# Altium schematic sheet Breakout.SchDoc
size A4; SheetNumber: 1; SheetTotal: 1
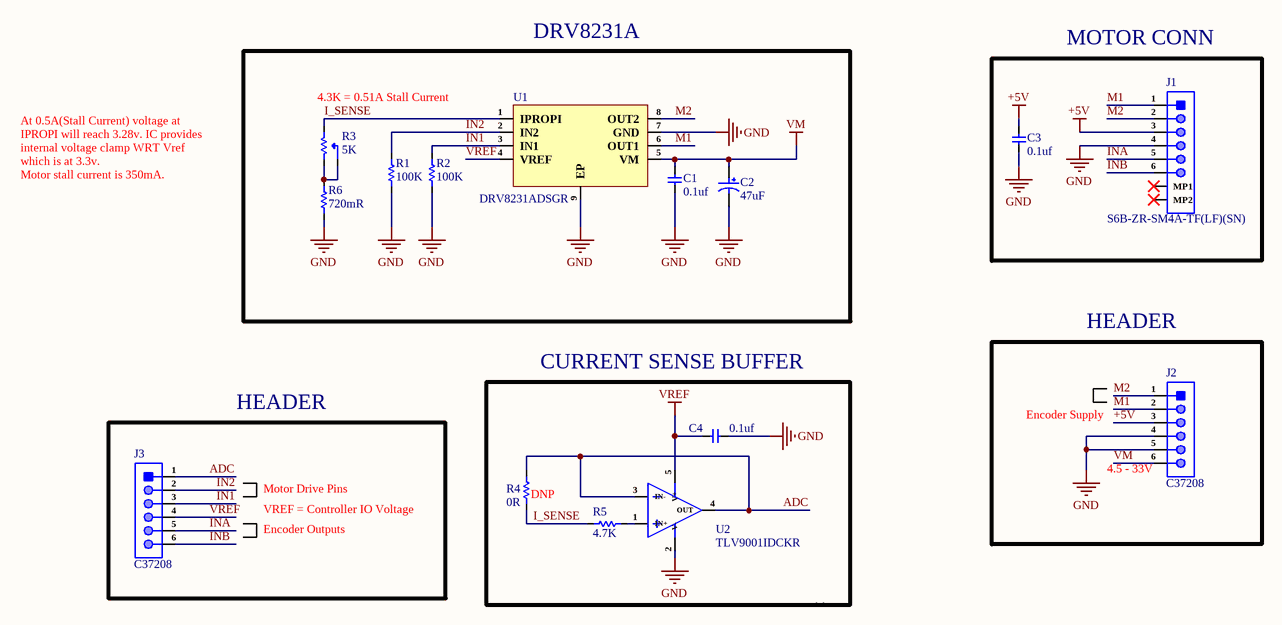
[diagram p0: Breakout.SchDoc]

## Parts
C1  0.1uf  [Cap-0402]
C2  47uF  [Case-D]
C3  0.1uf  [Cap-0402]
C4  0.1uf  [Cap-0402]
J1  S6B-ZR-SM4A-TF(LF)(SN)  [S6B-ZR-SM4A-TF(LF)(SN)]
J2  C37208  [HDR1X6_]
J3  C37208  [HDR1X6_]
R1  100K  [Res-0201]
R2  100K  [Res-0201]
R3  5K  [3361P-1-502GLF]
R4  DNP  [Res-0402]
R5  4.7K  [Res-0201]
R6  720mR  [Res-1206]
U1  DRV8231ADSGR  [WSON-8(2x2)]
U2  TLV9001IDCKR  [SC-70-5]

## Blocks framed on the sheet
DRV8231A: C1 C2 R1-R3 R6 U1
MOTOR CONN: C3 J1
HEADER: J2
HEADER: J3

## Nets
+5V: C3.2 J1.3 J2.3
GND: C1.1 C2.2 C3.1 C4.1 J1.4 J2.4 J2.5 R1.1 R2.1 R6.1 U1.7(GND) U1.9(EP) U2.2(V-)
VM: C1.2 C2.1 J2.6 U1.5(VM)
VREF: C4.2 J3.4 U1.4(VREF) U2.5(V+)
ADC: J3.1 R4.2 U2.3(IN-) U2.4(OUT)
I_SENSE: R3.3(CW) R4.1 R5.1 U1.1(IPROPI)
IN1: J3.3 R2.2 U1.3(IN1)
IN2: J3.2 R1.2 U1.2(IN2)
INA: J1.5 J3.5
INB: J1.6 J3.6
M1: J1.1 J2.2 U1.6(OUT1)
M2: J1.2 J2.1 U1.8(OUT2)
NetR3_1: R3.1(CCW) R3.2(Wiper) R6.2
NetR5_2: R5.2 U2.1(IN+)

Not connected (* = marked no-connect by the designer): J1 MP1* MP2*

## Notes on the sheet
- 4.3K = 0.51A Stall Current
- At 0.5A(Stall Current) voltage at IPROPI will reach 3.28v. IC provides internal voltage clamp WRT Vref which is at 3.3v.
  Motor stall current is 350mA.
- CURRENT SENSE BUFFER
- Encoder Supply
- (near J2) 4.5 - 33V
- VREF = Controller IO Voltage
- Encoder Outputs
- Motor Drive Pins
- (near R4) 0R
- File:
- Title:
- Date:
- Page
- Num:
- Total:
- Drawn By: Huzaifa Ali

## Library data of the parts
C1 C3 C4 = GRM155R62A104KE14D: CAP CER 0.1UF 100V X5R 0402; Manufacturer: Murata; Capacitance: 100nF; Tolerance: 10%; Item Type: Capacitor; Supplier 1: Arrow Electronics; Manufacturer Part Number: GRM155R62A104KE14D; RoHS: Yes; Category: Ceramic Capacitors; Stock 1: 870000; Pricing 1: 10000=0.00500, 20000=0.00410, 30000=0.00390, 50000=0.00370, 100000=0.00300 (USD); Mount: Surface Mount; Case/Package: 0402; Case Code (Metric): 1005; Case Code (Imperial): 0402; Weight: 0.000212oz; Min Operating Temperature: -55°C; Max Operating Temperature: 85°C; Packaging: Tape and Reel; Voltage Rating: 100V; Dielectric: X5R; Termination: SMD/SMT; Voltage Rating (DC): 100V; Package Quantity: 10000; Series: GRM; Length: 0.039inch; Width: 0.02inch; Height: 0.5mm; Thickness: 0.022inch; Reach SVHC Compliant: Yes; Lead Free: Lead Free; RoHS Compliant: Yes; ComponentLink1URL: http://www.farnell.com/datasheets/2079151.pdf?src-supplier=Farnell; ComponentLink1Description: http://www.farnell.com/datasheets/2079151.pdf?src-supplier=Farnell; ComponentLink2URL: http://www.mouser.com/ds/2/281/c02e-2905.pdf?src-supplier=Mouser; ComponentLink2Description: http://www.mouser.com/ds/2/281/c02e-2905.pdf?src-supplier=Mouser; ComponentLink3URL: http://www.farnell.com/datasheets/2079151.pdf?src-supplier=Element14; ComponentLink3Description: http://www.farnell.com/datasheets/2079151.pdf?src-supplier=Element14; ComponentLink4URL: http://search.murata.co.jp/Ceramy/image/img/A01X/G101/ENG/GRM155R62A104KE14-01.pdf?src-supplier=Digi-Key; ComponentLink4Description: http://search.murata.co.jp/Ceramy/image/img/A01X/G101/ENG/GRM155R62A104KE14-01.pdf?src-supplier=Digi-Key; ComponentLink5URL: http://www.farnell.com/datasheets/2079151.pdf?src-supplier=Newark; ComponentLink5Description: http://www.farnell.com/datasheets/2079151.pdf?src-supplier=Newark; Supplier Part Number 1: GRM155R62A104KE14D; LCSC Part Number: C162178
C2 = CA45-D025K476T: 47uF 25V 0.9Ω@100kHz ±10% CASE-D-7343 Tantalum Capacitors ROHS; Manufacturer: Hunan Xiangyee in S&T; Manufacturer Part Number: CA45-D025K476T; ComponentLink1URL: https://www.lcsc.com/product-detail/Tantalum-Capacitors_Hunan-Xiangyee-in-S-T-CA45-D025K476T_C123267.html; ComponentLink1Description: LCSC; LCSC Part Number: C123267; Item Type: Capacitor; Package: CASE-D-7343
J1 = S6B-ZR-SM4A-TF(LF)(SN): CONN HEADER SMD R/A 6POS 1.5MM; Manufacturer: JST; Item Type: Wire To Board Connector; Supplier: Arrow Electronics; Supplier Part Number: S6B-ZR-SM4A-TF(LF)(SN); Manufacturer Part Number: S6B-ZR-SM4A-TF(LF)(SN); RoHS: Yes; Category: Headers and Wire Housings; Stock: 49000; Pricing: 1000=0.4135, 2000=0.3766, 5000=0.3642, 10000=0.3395, 25000=0.3272, 50000=0.327 (USD); ComponentLink1URL: https://datasheet.ciiva.com/26894/getdatasheetpartid-724069-26894934.pdf?src-supplier=Verical; ComponentLink1Description: https://datasheet.ciiva.com/26894/getdatasheetpartid-724069-26894934.pdf?src-supplier=Verical; ComponentLink2URL: https://datasheet.ciiva.com/26924/getdatasheetpartid-640743-26924052.pdf?src-supplier=Verical; ComponentLink2Description: https://datasheet.ciiva.com/26924/getdatasheetpartid-640743-26924052.pdf?src-supplier=Verical; LCSC Part Number: C265070
J2 J3 = C37208: Straight 1 6 2.54mm Black Brass Plugin,P=2.54mm Pin Headers ROHS; Manufacturer: BOOMELEC; Item Type: Header; Manufacturer Part Number: C37208; Package: Custom; ComponentLink1Description: New link; ComponentLink1URL: https://www.lcsc.com/product-detail/Pin-Headers_BOOMELE-Boom-Precision-Elec-C37208_C37208.html; LCSC Part Number: C37208
R1 R2 = RC0201JR-07100KL: RES SMD 100K OHM 5% 1/20W 0201; Manufacturer: Yageo; Resistance: 100kR; Temperature Coefficient: 200ppm/°C; Power Rating: 50mW; Voltage Rating: 25V; Supplier 1: Arrow Electronics; Manufacturer Part Number: RC0201JR-07100KL; RoHS: Yes; Category: Chip SMD Resistors; Stock 1: 76; Pricing 1: 1=0.09240, 10=0.09140, 25=0.05450, 10000=0.00340, 100000=0.00320, 1000000=0.00180, 5000000=0.00110 (USD); Case/Package: 0201; Contact Plating: Tin,Matte; Case Code (Metric): 0603; Case Code (Imperial): 0201; Weight: 6E-06oz; Size Code: 0201; Min Operating Temperature: -55°C; Max Operating Temperature: 125°C; Tolerance: 5%; Resistor Type: Thick Film; Package Quantity: 1; Packaging: Tape and Reel; Number of Terminations: 2; Termination: SMD/SMT; Max Power Dissipation: 50mW; Voltage Rating (DC): 25V; Features: Moisture Resistant; Series: RC; Resistance Tolerance: 5%; Construction: Rectangular; Length: 0.6mm; Width: 0.012inch; Height: 0.01inch; Depth: 0.3mm; Radiation Hardening: No; REACH SVHC: No SVHC; Military Standard: Not; Lead Free: Lead Free; RoHS Compliant: Yes; ComponentLink1URL: https://datasheet.ciiva.com/2462/pyu-r-int-thick-7-2462817.pdf?src-supplier=Digi-Key; ComponentLink1Description: https://datasheet.ciiva.com/2462/pyu-r-int-thick-7-2462817.pdf?src-supplier=Digi-Key; ComponentLink2URL: https://datasheet.ciiva.com/2462/pyu-r-int-thick-7-2462818.pdf?src-supplier=Digi-Key; ComponentLink2Description: https://datasheet.ciiva.com/2462/pyu-r-int-thick-7-2462818.pdf?src-supplier=Digi-Key; ComponentLink3URL: https://datasheet.ciiva.com/2462/pyu-r-int-thick-7-2462819.pdf?src-supplier=Digi-Key; ComponentLink3Description: https://datasheet.ciiva.com/2462/pyu-r-int-thick-7-2462819.pdf?src-supplier=Digi-Key; ComponentLink4URL: https://datasheet.ciiva.com/8888/pyu-rc0201-51-rohs-l-8-8888005.pdf?src-supplier=Avnet; ComponentLink4Description: https://datasheet.ciiva.com/8888/pyu-rc0201-51-rohs-l-8-8888005.pdf?src-supplier=Avnet; ComponentLink5URL: https://datasheet.ciiva.com/8896/pyu-rc0201-51-rohs-l-8-8896213.pdf?src-supplier=Avnet; ComponentLink5Description: https://datasheet.ciiva.com/8896/pyu-rc0201-51-rohs-l-8-8896213.pdf?src-supplier=Avnet; ComponentLink6URL: https://datasheet.ciiva.com/28395/pyu-rc0201-51-rohs-l-8-28395542.pdf?src-supplier=Avnet+Europe; ComponentLink6Description: https://datasheet.ciiva.com/28395/pyu-rc0201-51-rohs-l-8-28395542.pdf?src-supplier=Avnet+Europe; ComponentLink7URL: https://datasheet.ciiva.com/28639/1421516-28639863.pdf?src-supplier=Element14; ComponentLink7Description: https://datasheet.ciiva.com/28639/1421516-28639863.pdf?src-supplier=Element14; ComponentLink8URL: https://datasheet.ciiva.com/7672/1563626-7672249.pdf?src-supplier=Element14; ComponentLink8Description: https://datasheet.ciiva.com/7672/1563626-7672249.pdf?src-supplier=Element14; ComponentLink9URL: https://datasheet.ciiva.com/7672/1563626-7672250.pdf?src-supplier=Element14; ComponentLink9Description: https://datasheet.ciiva.com/7672/1563626-7672250.pdf?src-supplier=Element14; Supplier Part Number 1: RC0201JR-07100KL; LCSC Part Number: C106230
R3 = 3361P-1-502GLF: Resistor Cermet Trimmer 5K Ohm 10% 1/2W 1(Elec)/1(Mech)Turn 2.77mm Gull Wing SMD Embossed T/R; Manufacturer: Bourns; Value: 5kR; Power Rating: 500mW; Voltage Rating: 300V; Number of Turns: 1; Temperature Coefficient: 100ppm/°C; Supplier: Digikey; Supplier Part Number: 3361P-502GLFCT-ND; Manufacturer Part Number: 3361P-1-502GLF; RoHS: Yes; Category: Variable Resistors and Potentiometers; Stock: 12713; Pricing: 1=1.27, 10=1.121, 25=1.0088, 50=0.9716, 100=0.9342, 250=0.8782 (USD); Mounting Technology: Surface Mount; Weight: 0.567g; Min Operating Temperature: -55°C; Max Operating Temperature: 125°C; Tolerance: 10%; Resistor Type: Cermet; Packaging: Tape and Reel; Package Quantity: 1; Taper: Linear; Termination: Gull Wing; Max Power Dissipation: 500mW; Series: Trimpot® 3361 - Sealed; Resistance Tolerance: 10%; Technology: CERMET; Voltage Rating (DC): 300V; Length: 6.71mm; Width: 0.264inch; Height: 0.192inch; Depth: 8.53mm; Radiation Hardening: No; Reach SVHC Compliant: No; Military Standard: Not; RoHS Compliant: Yes; ComponentLink1URL: https://datasheet.ciiva.com/6197/1443095-6197504.pdf?src-supplier=Farnell; ComponentLink1Description: https://datasheet.ciiva.com/6197/1443095-6197504.pdf?src-supplier=Farnell; ComponentLink2URL: https://datasheet.ciiva.com/27056/2033666-27056369.pdf?src-supplier=Jameco; ComponentLink2Description: https://datasheet.ciiva.com/27056/2033666-27056369.pdf?src-supplier=Jameco; ComponentLink3URL: https://datasheet.ciiva.com/11833/0900766b80fe1d0c-11833209.pdf?src-supplier=Rs; ComponentLink3Description: https://datasheet.ciiva.com/11833/0900766b80fe1d0c-11833209.pdf?src-supplier=Rs; ComponentLink4URL: https://datasheet.ciiva.com/1477/1846252-1477777.pdf?src-supplier=Element14; ComponentLink4Description: https://datasheet.ciiva.com/1477/1846252-1477777.pdf?src-supplier=Element14; ComponentLink5URL: https://datasheet.ciiva.com/1477/1846252-1477776.pdf?src-supplier=Element14; ComponentLink5Description: https://datasheet.ciiva.com/1477/1846252-1477776.pdf?src-supplier=Element14; ComponentLink6URL: https://datasheet.ciiva.com/28666/1733537-28666333.pdf?src-supplier=Element14; ComponentLink6Description: https://datasheet.ciiva.com/28666/1733537-28666333.pdf?src-supplier=Element14; ComponentLink7URL: https://datasheet.ciiva.com/3266/3361-3266693.pdf?src-supplier=Avnet; ComponentLink7Description: https://datasheet.ciiva.com/3266/3361-3266693.pdf?src-supplier=Avnet; ComponentLink8URL: https://datasheet.ciiva.com/2156/3361-2156181.pdf?src-supplier=Digikey; ComponentLink8Description: https://datasheet.ciiva.com/2156/3361-2156181.pdf?src-supplier=Digikey; ComponentLink9URL: https://datasheet.ciiva.com/2156/3361-2156179.pdf?src-supplier=Digikey; ComponentLink9Description: https://datasheet.ciiva.com/2156/3361-2156179.pdf?src-supplier=Digikey; ComponentLink10URL: https://datasheet.ciiva.com/15225/getdatasheetpartid-162034-15225196.pdf?src-supplier=Verical; ComponentLink10Description: https://datasheet.ciiva.com/15225/getdatasheetpartid-162034-15225196.pdf?src-supplier=Verical; ComponentLink11URL: https://datasheet.ciiva.com/3266/3361-3266694.pdf?src-supplier=Avnet; ComponentLink11Description: https://datasheet.ciiva.com/3266/3361-3266694.pdf?src-supplier=Avnet; ComponentLink12URL: https://datasheet.ciiva.com/2156/3361-2156180.pdf?src-supplier=Digikey; ComponentLink12Description: https://datasheet.ciiva.com/2156/3361-2156180.pdf?src-supplier=Digikey; ComponentLink13URL: https://datasheet.ciiva.com/16716/70153632-16716878.pdf?src-supplier=Allied+Electronics; ComponentLink13Description: https://datasheet.ciiva.com/16716/70153632-16716878.pdf?src-supplier=Allied+Electronics
R4 = AC0402FR-070RL: RESISTOR 0402 JUMPER ZERO OHM; Manufacturer: Yageo; Voltage Rating: 50V; Power Rating: 62.5mW; Tolerance: 1%; Value: 0R; Temperature Coefficient: 200ppm/°C; Supplier: Digi-Key; Supplier Part Number: 13-AC0402FR-070RLDKR-ND; Manufacturer Part Number: AC0402FR-070RL; RoHS: Yes; Category: Chip SMD Resistors; Stock: 337140; Pricing: 1=0.1, 10=0.017, 25=0.0132, 50=0.01, 100=0.0071, 250=0.00568, 500=0.00454, 1000=0.00335, 5000=0.0024 (USD); Case/Package: 0402; Case Code (Imperial): 0402; Case Code (Metric): 1005; Min Operating Temperature: -55°C; Max Operating Temperature: 155°C; Packaging: Tape and Reel; Termination: SMD/SMT; Series: AC; Height: 370um; ComponentLink1URL: https://datasheet.ciiva.com/12656/pyu-ac-51-rohs-l-2-12656734.pdf?src-supplier=Mouser; ComponentLink1Description: https://datasheet.ciiva.com/12656/pyu-ac-51-rohs-l-2-12656734.pdf?src-supplier=Mouser; LCSC Part Number: C226739; Item Type: Resistor; ComponentLink2Description: LCSC; ComponentLink2URL: https://www.lcsc.com/product-detail/Chip-Resistor-Surface-Mount_YAGEO-AC0402FR-070RL_C226739.html
R5 = RC0201FR-074K7L: RES 4.7K OHM 1% 1/20W 0201; Manufacturer: Yageo; Item Type: Resistor; Supplier: Future Electronics; Supplier Part Number: 7537285; Manufacturer Part Number: RC0201FR-074K7L; RoHS: Yes; Category: Chip SMD Resistors; Stock: 1610000; Pricing: 10000=0.0014, 50000=0.0013, 250000=0.0013, 750000=0.0012, 2000000=0.0011 (USD); ComponentLink1URL: https://datasheet.ciiva.com/2493/pyu-r-int-thick-7-2493811.pdf?src-supplier=Digi-Key; ComponentLink1Description: https://datasheet.ciiva.com/2493/pyu-r-int-thick-7-2493811.pdf?src-supplier=Digi-Key; ComponentLink2URL: https://datasheet.ciiva.com/2493/pyu-r-int-thick-7-2493812.pdf?src-supplier=Digi-Key; ComponentLink2Description: https://datasheet.ciiva.com/2493/pyu-r-int-thick-7-2493812.pdf?src-supplier=Digi-Key; ComponentLink3URL: https://datasheet.ciiva.com/2493/pyu-r-int-thick-7-2493813.pdf?src-supplier=Digi-Key; ComponentLink3Description: https://datasheet.ciiva.com/2493/pyu-r-int-thick-7-2493813.pdf?src-supplier=Digi-Key; ComponentLink4URL: https://datasheet.ciiva.com/8892/pyu-rc0201-51-rohs-l-8-8892942.pdf?src-supplier=Avnet; ComponentLink4Description: https://datasheet.ciiva.com/8892/pyu-rc0201-51-rohs-l-8-8892942.pdf?src-supplier=Avnet; ComponentLink5URL: https://datasheet.ciiva.com/7672/1563626-7672233.pdf?src-supplier=Element14; ComponentLink5Description: https://datasheet.ciiva.com/7672/1563626-7672233.pdf?src-supplier=Element14; LCSC Part Number: C138135
R6 = CR1206FR720P05R: 250mW 720mΩ ±600ppm/℃ ±1% 1206 Current Sense Resistors/Shunt Resistors ROHS; Manufacturer: Ever Ohms Tech; Manufacturer Part Number: CR1206FR720P05R; Package: 1206; ComponentLink1Description: LCSC; ComponentLink1URL: https://www.lcsc.com/product-detail/Current-Sense-Resistors-Shunt-Resistors_Ever-Ohms-Tech-CR1206FR720P05R_C175810.html; LCSC Part Number: C175810; Item Type: Resistor
U1 = DRV8231ADSGR: 33V H BRIDGE MOTOR DRIVER WITH C; Manufacturer: Texas Instruments; Item Type: IC; Number of Channels: 1NUMBER; Supplier: Mouser; Supplier Part Number: 595-DRV8231ADSGR; Manufacturer Part Number: DRV8231ADSGR; RoHS: No; Stock: 8609; Pricing: 1=1.52, 10=1.29, 50=1.29, 100=1.1, 1000=0.747, 10000=0.657 (USD); Pins: 8NUMBER; Length: 2mm; Width: 2mm; Height: 800um; Thickness: 750um; LCSC Part Number: C5139865
U2 = TLV9001IDCKR: IC CMOS 1 CIRCUIT SC70-5; Manufacturer: Texas Instruments; Number of Channels: 1; Slew Rate: 2V/µs; Gain Bandwidth Product: 1MHz; Input Bias Current: 5pA; Input Offset Voltage (Vos): 400uV; Operating Supply Current: 60uA; Output Current per Channel: 40mA; Supplier: Mouser; Supplier Part Number: 595-TLV9001IDCKR; Manufacturer Part Number: TLV9001IDCKR; RoHS: Yes; Item Type: IC; Stock: 13115; Pricing: 1=0.47, 10=0.348, 50=0.348, 100=0.194, 1000=0.146, 10000=0.117 (USD); Mounting Technology: Surface Mount; Min Operating Temperature: -40°C; Max Operating Temperature: 125°C; Packaging: Cut Tape; Number of Circuits: 1; Series: -; RoHS Compliant: Yes; ComponentLink1URL: http://www.ti.com/lit/ds/symlink/tlv9001.pdf?src-supplier=Digikey; ComponentLink1Description: http://www.ti.com/lit/ds/symlink/tlv9001.pdf?src-supplier=Digikey; LCSC Part Number: C398362